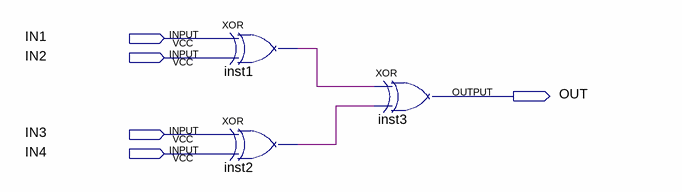
[diagram p0: schematic sheet]
// Quartus schematic XOR4.bdf as structural Verilog: 3 symbols, 5 pins
module XOR4 (
  input  IN1,
  input  IN2,
  input  IN3,
  input  IN4,
  output OUT
);

  wire inst1_out, inst2_out;

  xor inst1 (inst1_out, IN1, IN2);
  xor inst2 (inst2_out, IN3, IN4);
  xor inst3 (OUT, inst1_out, inst2_out);
endmodule
